# Altium schematic sheet TOP.SchDoc
size A2; SheetNumber: 6; SheetTotal: 6
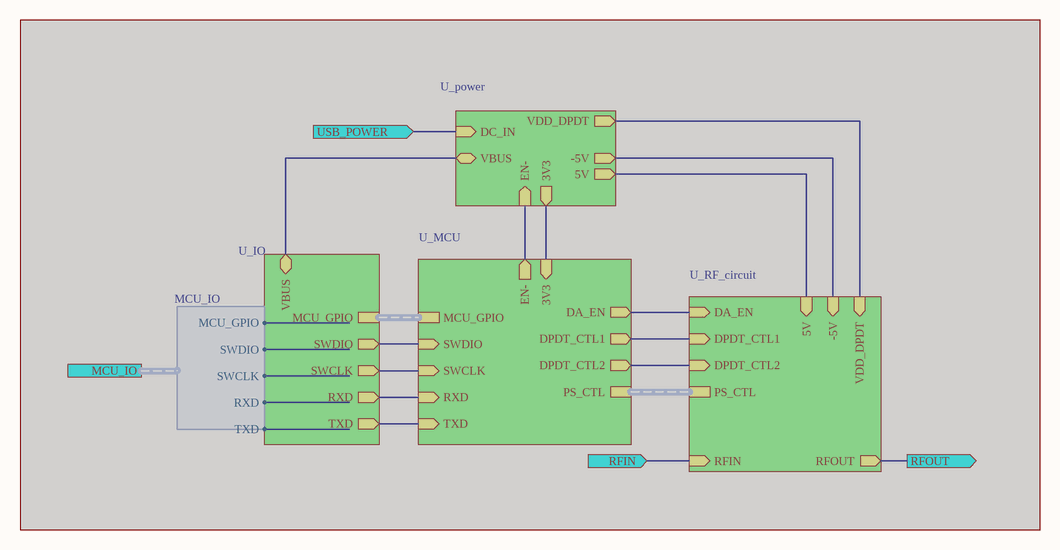
[diagram p0: TOP.SchDoc]

## Sub-sheets
U_IO = IO.SchDoc (masked out): SWDIO (out), SWCLK (out), MCU_GPIO (harness MCU_GPIO), TXD (out), RXD (out), VBUS (bidir)
U_MCU = MCU.SchDoc (masked out): MCU_GPIO (harness MCU_GPIO), 3V3 (in), EN- (out), DA_EN (out), DPDT_CTL1 (out), DPDT_CTL2 (out), SWDIO (in), SWCLK (in), RXD (in), TXD (in), PS_CTL (harness PS_CTL)
U_power = power.SchDoc (masked out): 3V3 (out), VDD_DPDT (out), -5V (out), 5V (out), EN- (in), VBUS (bidir), DC_IN (in)
U_RF_circuit = RF_circuit.SchDoc (masked out): -5V (in), DPDT_CTL1 (in), DPDT_CTL2 (in), PS_CTL (harness PS_CTL), DA_EN (in), VDD_DPDT (in), 5V (in), RFIN (in), RFOUT (out)

## Ports
MCU_IO (harness MCU_IO), RFIN (in), RFOUT (out), USB_POWER (in)

## Harnesses
MCU_IO: MCU_GPIO, SWDIO, SWCLK, RXD, TXD